# EasyEDA schematic SCH_Macro-Pad_2026-10-21.json
TITLE: MIDI Controller; REV: 1.0; Date: 2026-10-07; Sheet: 1/1; Drawn By: William George; Company: William George
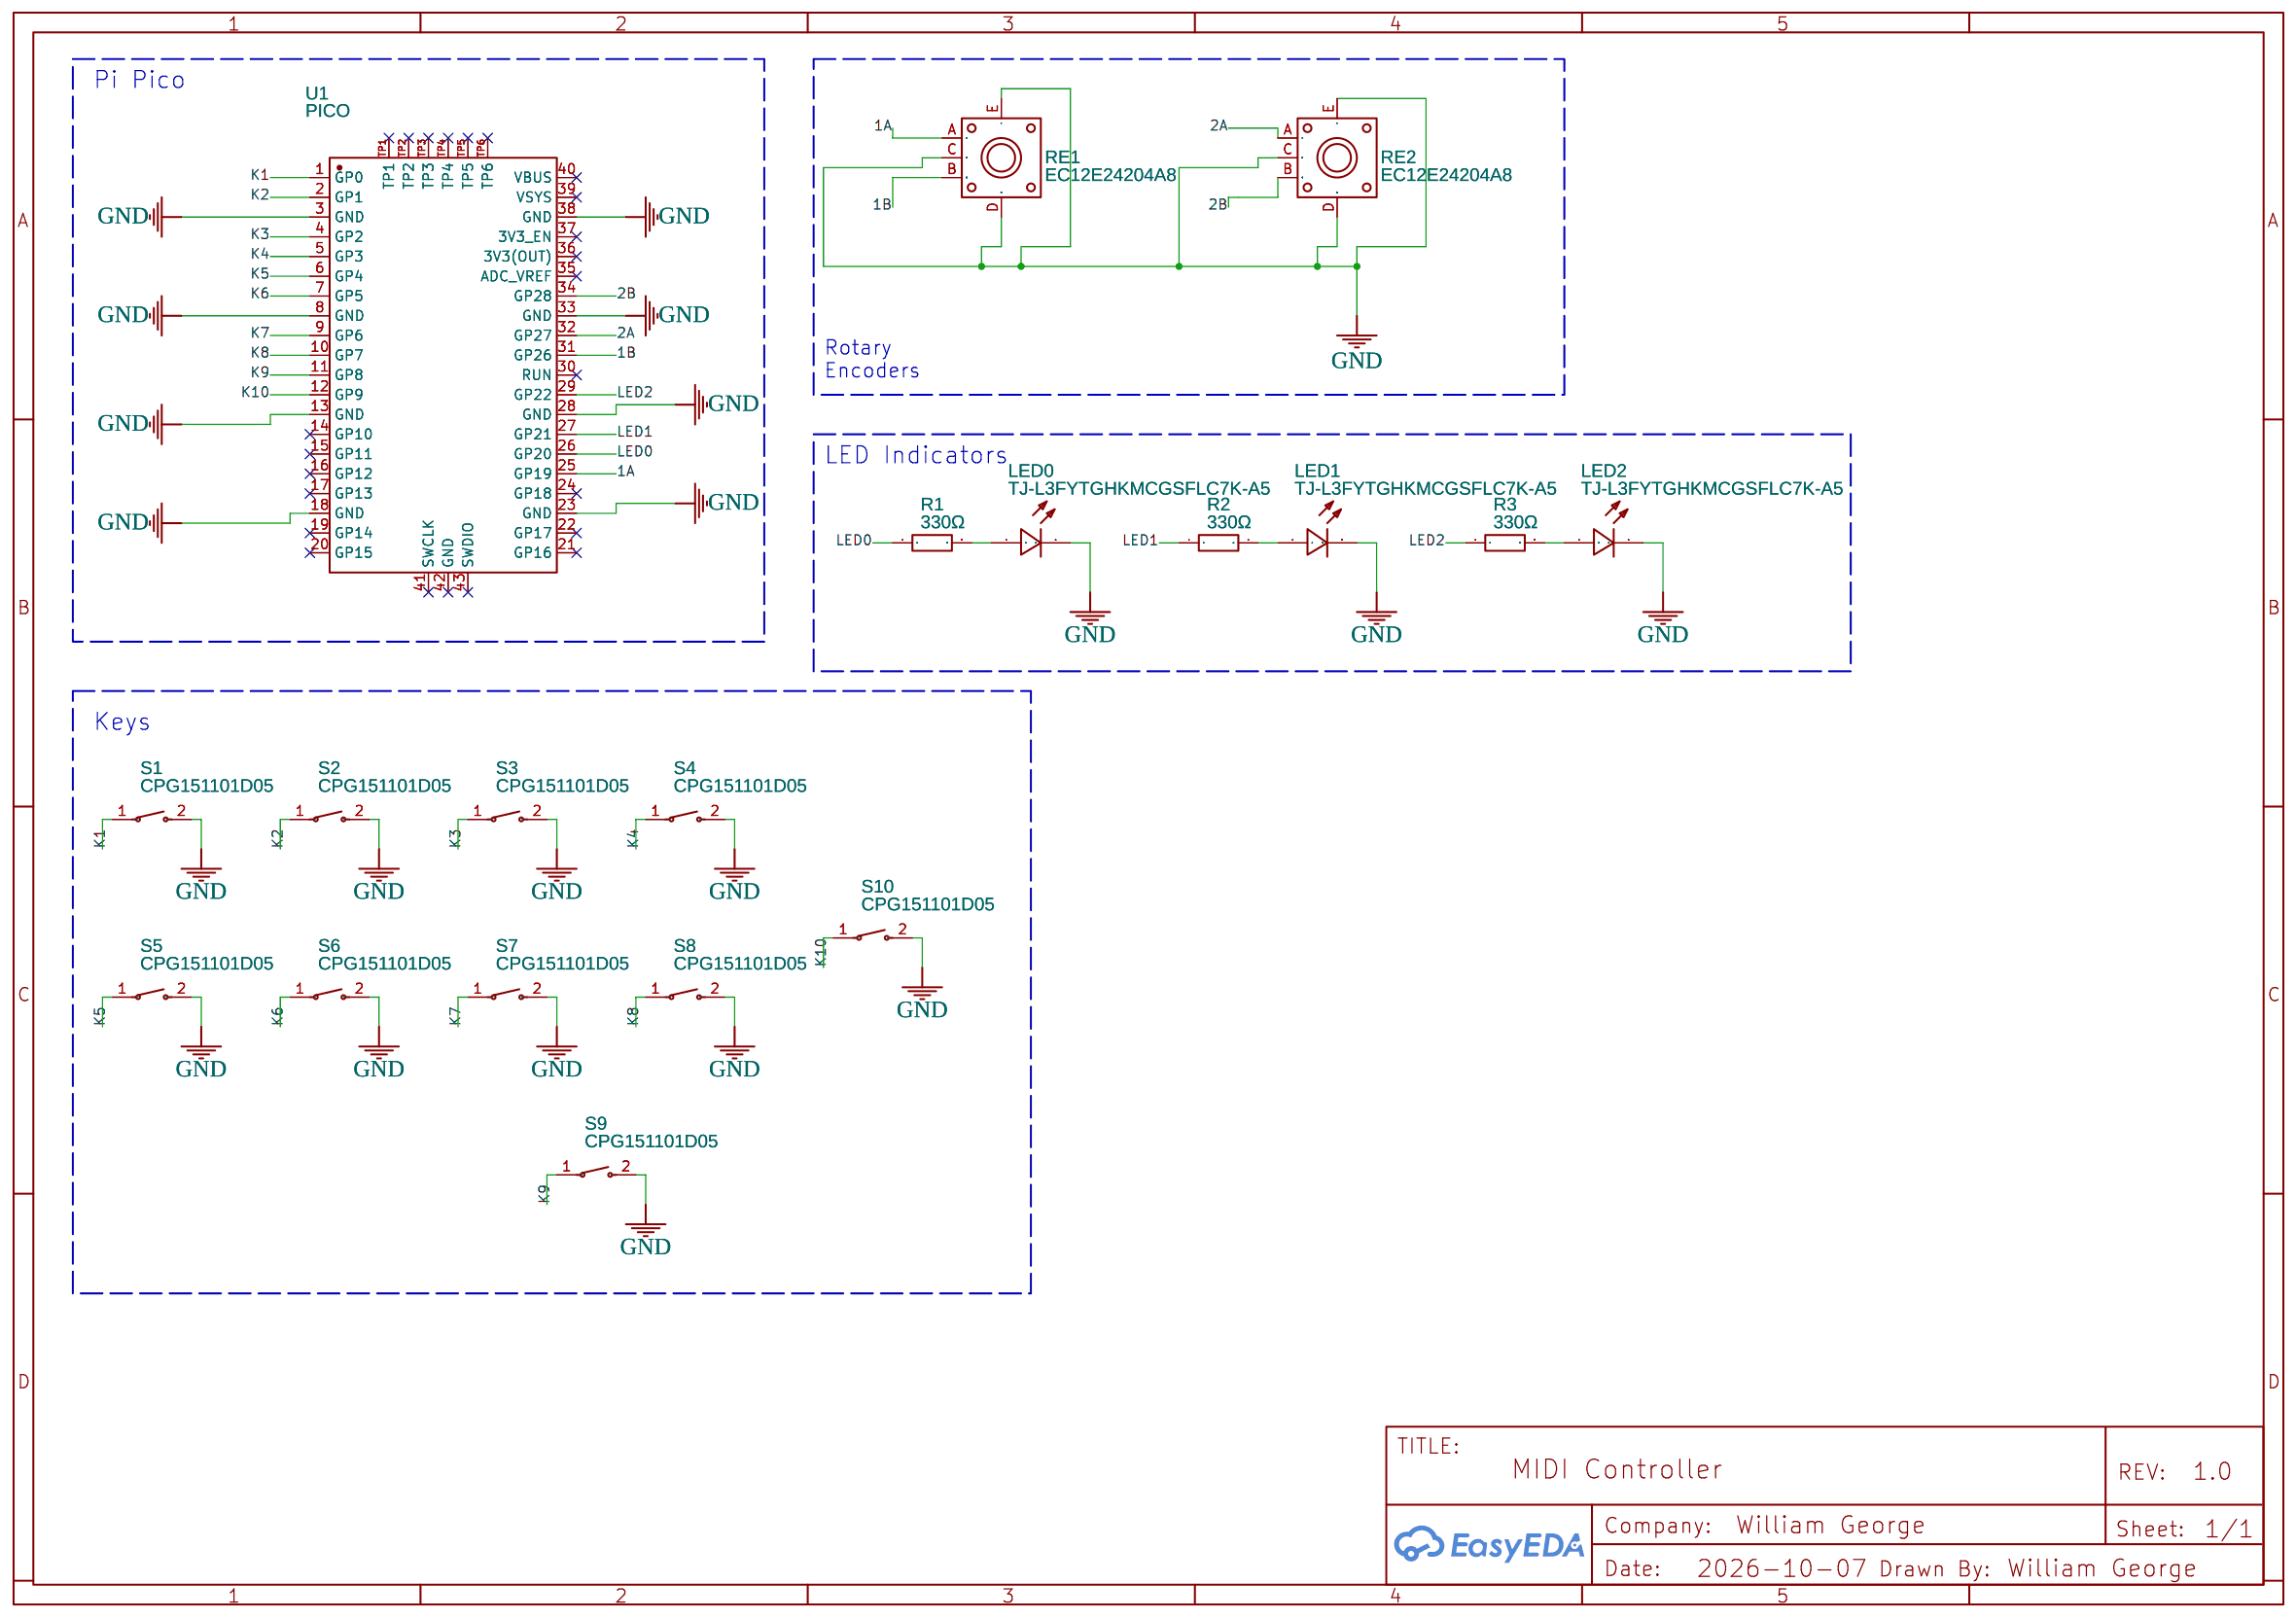
[diagram p0: schematic sheet]

## Parts
LED0  TJ-L3FYTGHKMCGSFLC7K-A5  [LED-TH_BD3.8-P2.54-FD]
LED1  TJ-L3FYTGHKMCGSFLC7K-A5  [LED-TH_BD3.8-P2.54-FD]
LED2  TJ-L3FYTGHKMCGSFLC7K-A5  [LED-TH_BD3.8-P2.54-FD]
R1  330Ω  [RES-TH_BD2.3-L6.5-P10.50-D0.5]
R2  330Ω  [RES-TH_BD2.3-L6.5-P10.50-D0.5]
R3  330Ω  [RES-TH_BD2.3-L6.5-P10.50-D0.5]
RE1  EC12E24204A8  [SW-TH_EC12EXXXX]
RE2  EC12E24204A8  [SW-TH_EC12EXXXX]
S1  CPG151101D05  [SW-TH_CPG151101D05]
S2  CPG151101D05  [SW-TH_CPG151101D05]
S3  CPG151101D05  [SW-TH_CPG151101D05]
S4  CPG151101D05  [SW-TH_CPG151101D05]
S5  CPG151101D05  [SW-TH_CPG151101D05]
S6  CPG151101D05  [SW-TH_CPG151101D05]
S7  CPG151101D05  [SW-TH_CPG151101D05]
S8  CPG151101D05  [SW-TH_CPG151101D05]
S9  CPG151101D05  [SW-TH_CPG151101D05]
S10  CPG151101D05  [SW-TH_CPG151101D05]
U1  PICO  [COMM-TH_RP2040_PI_PICO]

## Library data of the parts
LED0-LED2 = TJ-L3FYTGHKMCGSFLC7K-A5: Contributor: LCSC; Supplier: LCSC; Supplier Part: C330747; Manufacturer: TOGIALED(统佳); JLCPCB Part Class: Extended Part
R1-R3 = MF1/4W-330Ω±1% T52: Contributor: LCSC; Supplier: LCSC; Supplier Part: C119313; Manufacturer: CCO(千志电子); Manufacturer Part: MF1/4W-330Ω±1% T; JLCPCB Part Class: Extended Part
RE1 RE2 = EC12E24204A8: Contributor: LCSC; Supplier: LCSC; Supplier Part: C470598; Manufacturer: ALPSALPINE(阿尔卑斯阿尔派); JLCPCB Part Class: Extended Part
S1-S10 = CPG151101D05: Supplier: LCSC; Supplier Part: C49234236; Manufacturer: HanElectricity(瀚源); JLCPCB Part Class: Extended Part; Contributor: lcsc
U1 = PICO: Supplier: LCSC; Supplier Part: C7203002; Manufacturer: Raspberry Pi(树莓派); Manufacturer Part: Raspberry Pi Pico; Contributor: lcsc; JLCPCB Part Class: Extended Part

## Nets
GND: LED0.2 LED1.2 LED2.2 RE1.C RE1.D RE1.E RE2.C RE2.D RE2.E S1.2 S2.2 S3.2 S4.2 S5.2 S6.2 S7.2 S8.2 S9.2 S10.2 U1.3(GND) U1.8(GND) U1.13(GND) U1.18(GND) U1.23(GND) U1.28(GND) U1.33(GND) U1.38(GND)
1A: RE1.A U1.25(GP19)
1B: RE1.B U1.31(GP26)
2A: RE2.A U1.32(GP27)
2B: RE2.B U1.34(GP28)
K1: S1.1 U1.1(GP0)
K2: S2.1 U1.2(GP1)
K3: S3.1 U1.4(GP2)
K4: S4.1 U1.5(GP3)
K5: S5.1 U1.6(GP4)
K6: S6.1 U1.7(GP5)
K7: S7.1 U1.9(GP6)
K8: S8.1 U1.10(GP7)
K9: S9.1 U1.11(GP8)
K10: S10.1 U1.12(GP9)
LED0: R1.1 U1.26(GP20)
LED1: R2.1 U1.27(GP21)
LED2: R3.1 U1.29(GP22)
Net-(LED0-1): LED0.1 R1.2
Net-(LED1-1): LED1.1 R2.2
Net-(LED2-1): LED2.1 R3.2

Not connected (* = marked no-connect by the designer): U1 14(GP10)* 15(GP11)* 16(GP12)* 17(GP13)* 19(GP14)* 20(GP15)* 21(GP16)* 22(GP17)* 24(GP18)* 30(RUN)* 35(ADC_VREF)* 36(3V3(OUT))* 37(3V3_EN)* 39(VSYS)* 40(VBUS)* 41(SWCLK)* 42(GND)* 43(SWDIO)* TP1* TP2* TP3* TP4* TP5* TP6*

## Notes on the sheet
- Pi Pico
- Rotary
  Encoders
- LED Indicators
- Keys
